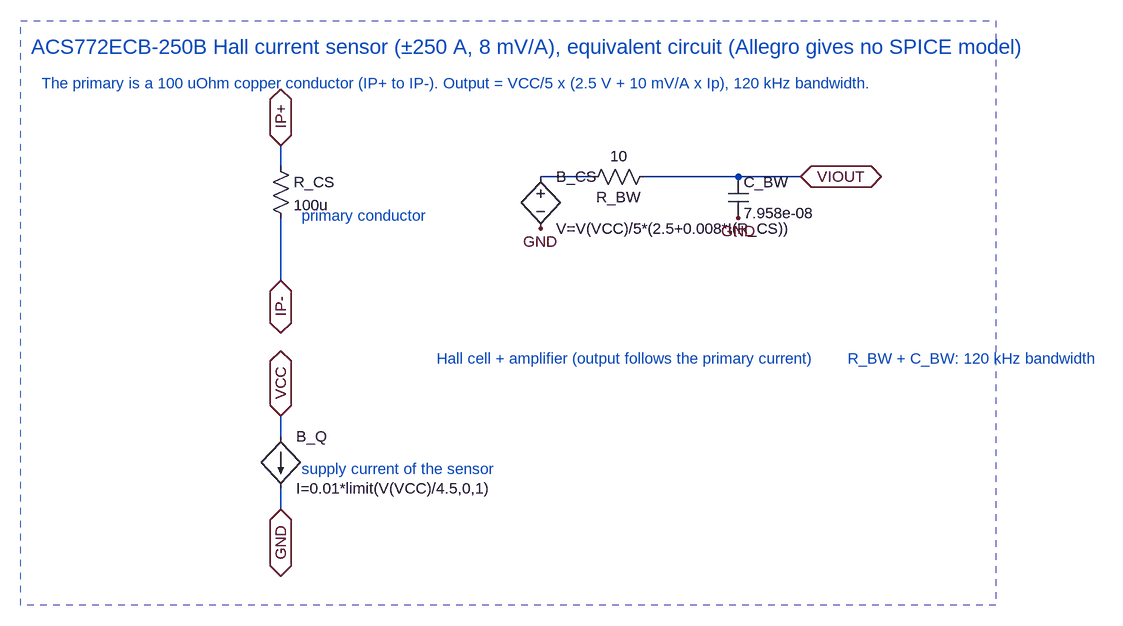
[diagram p0: schematic ACS772.asc]
ACS772.asc, the LTspice schematic file:
Version 4
SHEET 1 1888 1440
WIRE 400 192 400 224
WIRE 400 304 400 400
WIRE 400 608 400 640
WIRE 400 720 400 752
WIRE 800 240 880 240
WIRE 960 240 1104 240
WIRE 1104 240 1200 240
FLAG 400 192 IP+
FLAG 400 400 IP-
FLAG 800 320 GND
FLAG 1104 304 GND
FLAG 1200 240 VIOUT
FLAG 400 608 VCC
FLAG 400 752 GND
IOPIN 400 192 BiDir
IOPIN 400 400 BiDir
IOPIN 1200 240 BiDir
IOPIN 400 608 BiDir
IOPIN 400 752 BiDir
SYMBOL res 384 208 R0
SYMATTR InstName R_CS
SYMATTR Value 100u
SYMBOL bv 800 224 R0
SYMATTR InstName B_CS
SYMATTR Value V=V(VCC)/5*(2.5+0.008*I(R_CS))
SYMBOL res 864 256 R270
WINDOW 0 0 56 VBottom 2
WINDOW 3 32 56 VTop 2
SYMATTR InstName R_BW
SYMATTR Value 10
SYMBOL cap 1088 240 R0
SYMATTR InstName C_BW
SYMATTR Value 7.958e-08
SYMBOL bi 400 640 R0
SYMATTR InstName B_Q
SYMATTR Value I=0.01*limit(V(VCC)/4.5,0,1)
RECTANGLE Normal 1500 900 0 0 2
TEXT 16 40 Left 3 ;ACS772ECB-250B Hall current sensor (±250 A, 8 mV/A), equivalent circuit (Allegro gives no SPICE model)
TEXT 32 96 Left 2 ;The primary is a 100 uOhm copper conductor (IP+ to IP-). Output = VCC/5 x (2.5 V + 10 mV/A x Ip), 120 kHz bandwidth.
TEXT 432 300 Left 2 ;primary conductor
TEXT 640 520 Left 2 ;Hall cell + amplifier (output follows the primary current)        R_BW + C_BW: 120 kHz bandwidth
TEXT 432 690 Left 2 ;supply current of the sensor

The netlist it stands for:
* ACS772.asc
R_CS IP+ IP- 100u
B_CS N001 GND V=V(VCC)/5*(2.5+0.008*I(R_CS))
R_BW N001 VIOUT 10
C_BW VIOUT GND 7.958e-08
B_Q VCC GND I=0.01*limit(V(VCC)/4.5,0,1)
* ACS772ECB-250B Hall current sensor (±250 A, 8 mV/A), equivalent circuit (Allegro gives no SPICE model)
* The primary is a 100 uOhm copper conductor (IP+ to IP-). Output = VCC/5 x (2.5 V + 10 mV/A x Ip), 120 kHz bandwidth.
* primary conductor
* Hall cell + amplifier (output follows the primary current)        R_BW + C_BW: 120 kHz bandwidth
* supply current of the sensor
.backanno
.end